# Altium project STEMxS_V1.00.01.PrjPcb
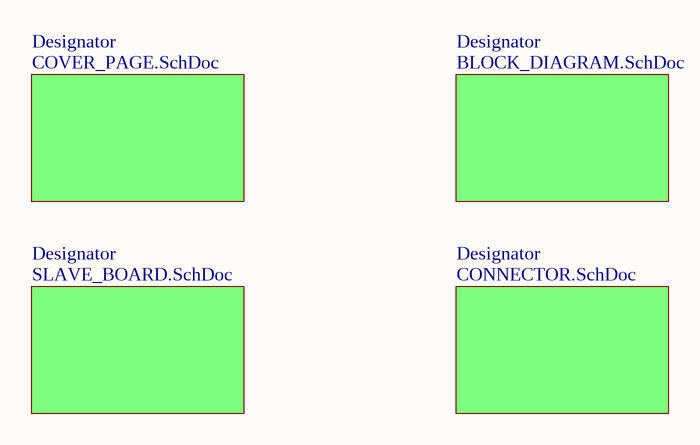
[diagram p0: LINK_PAGE.SchDoc]
5 sheets, 23 parts. Net scope: global (net labels, ports and power ports of the same name join across sheets).
Board file: STEMxS_V1.00.01.PcbDoc
Sheets:
  LINK_PAGE.SchDoc
    Designator = COVER_PAGE.SchDoc
    Designator = BLOCK_DIAGRAM.SchDoc
    Designator = SLAVE_BOARD.SchDoc
    Designator = CONNECTOR.SchDoc

## Sheet LINK_PAGE.SchDoc
size A; SheetNumber: 1; SheetTotal: 5

### Sub-sheets
Designator = COVER_PAGE.SchDoc: no entries
Designator = BLOCK_DIAGRAM.SchDoc: no entries
Designator = SLAVE_BOARD.SchDoc: no entries
Designator = CONNECTOR.SchDoc: no entries

## Sheet COVER_PAGE.SchDoc
size A; SheetNumber: 2; SheetTotal: 4

## Sheet BLOCK_DIAGRAM.SchDoc
size A; SheetNumber: 3; SheetTotal: 4

## Sheet SLAVE_BOARD.SchDoc
size A; SheetNumber: 4; SheetTotal: 5
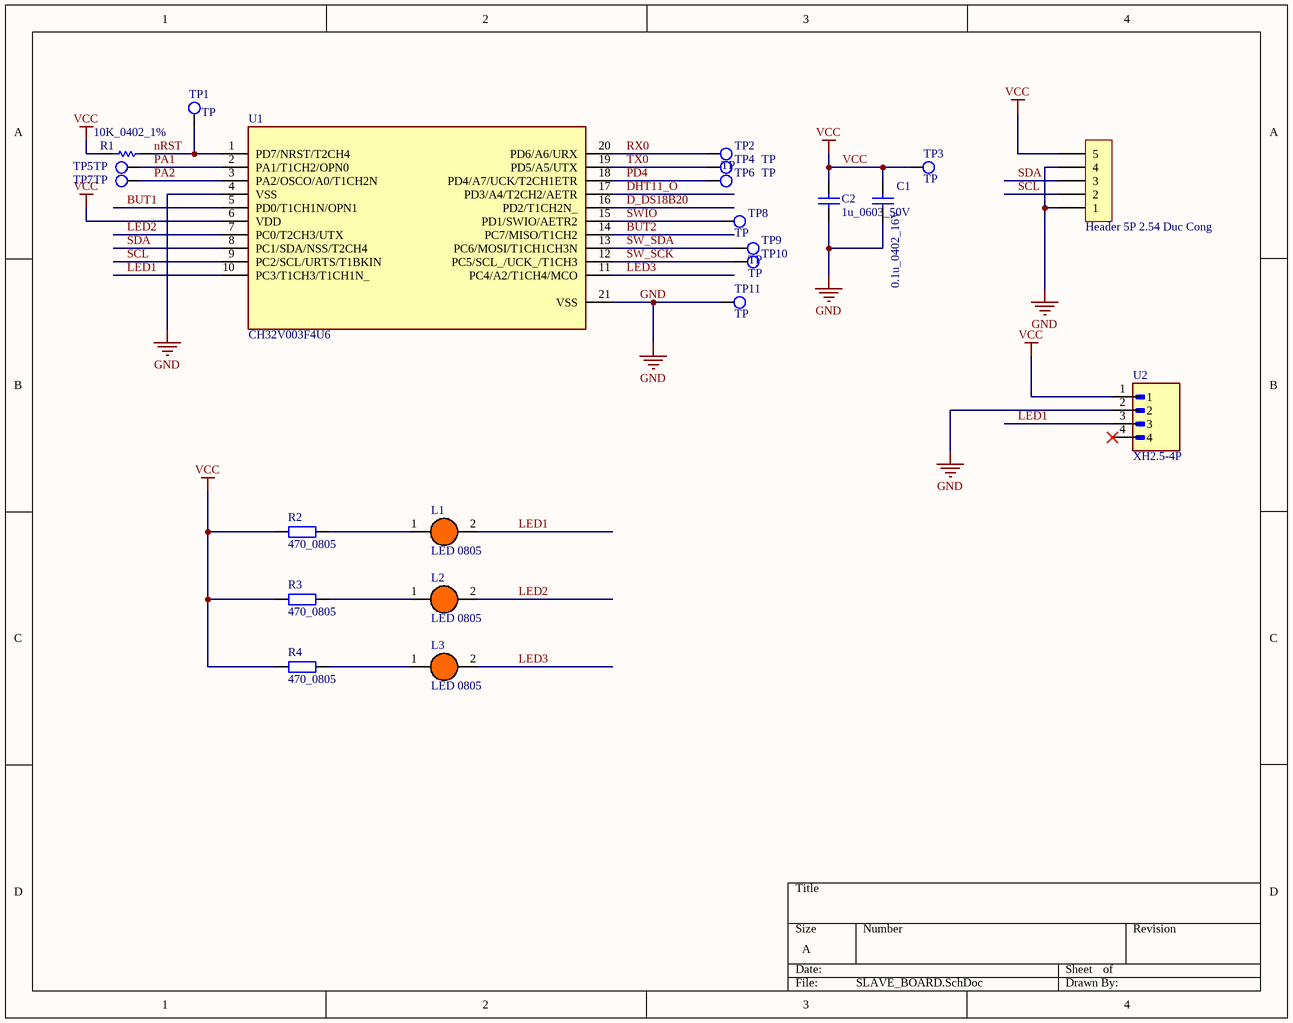
[diagram p1: SLAVE_BOARD.SchDoc]

### Parts
C1  0.1u_0402_16V  [C0402]
C2  1u_0603_50V  [C0603]
H1  Header 5P 2.54 Duc Cong  [Header 5P DC 2.54]
L1  LED 0805  [LED-0805-Orange]
L2  LED 0805  [LED-0805-Orange]
L3  LED 0805  [LED-0805-Orange]
R1  10K_0402_1%  [R0402]
R2  470_0805  [tro smd 0805]
R3  470_0805  [tro smd 0805]
R4  470_0805  [tro smd 0805]
TP1  TP  [TP_1mm]
TP2  TP  [TP_1mm]
TP3  TP  [TP_1mm]
TP4  TP  [TP_1mm]
TP5  TP  [TP_1mm]
TP6  TP  [TP_1mm]
TP7  TP  [TP_1mm]
TP8  TP  [TP_1mm]
TP9  TP  [TP_1mm]
TP10  TP  [TP_1mm]
TP11  TP  [TP_1mm]
U1  CH32V003F4U6  [QFN20_3X3]
U2  XH2.5-4P  [XH2.5-4P]

### Nets
GND: C1.1 C2.1 H1.1 H1.4 TP11.1 U1.4(VSS) U1.21(VSS) U2.2
VCC: C1.2 C2.2 H1.5 R1.1 R2.1 R3.1 R4.1 TP3.1 U1.6(VDD) U2.1
BUT1: U1.5(PD0/T1CH1N/OPN1)
BUT2: U1.14(PC7/MISO/T1CH2)
D_DS18B20: U1.16(PD2/T1CH2N_)
DHT11_O: U1.17(PD3/A4/T2CH2/AETR)
LED1: L1.2(K) U1.10(PC3/T1CH3/T1CH1N_) U2.3
LED2: L2.2(K) U1.7(PC0/T2CH3/UTX)
LED3: L3.2(K) U1.11(PC4/A2/T1CH4/MCO)
nRST: R1.2 TP1.1 U1.1(PD7/NRST/T2CH4)
PA1: TP5.1 U1.2(PA1/T1CH2/OPN0)
PA2: TP7.1 U1.3(PA2/OSCO/A0/T1CH2N)
PD4: TP6.1 U1.18(PD4/A7/UCK/T2CH1ETR)
RX0: TP2.1 U1.20(PD6/A6/URX)
SCL: H1.2 U1.9(PC2/SCL/URTS/T1BKIN)
SDA: H1.3 U1.8(PC1/SDA/NSS/T2CH4)
SW_SCK: TP10.1 U1.12(PC5/SCL_/UCK_/T1CH3)
SW_SDA: TP9.1 U1.13(PC6/MOSI/T1CH1CH3N)
SWIO: TP8.1 U1.15(PD1/SWIO/AETR2)
TX0: TP4.1 U1.19(PD5/A5/UTX)
NetL1_1: L1.1(A) R2.2
NetL2_1: L2.1(A) R3.2
NetL3_1: L3.1(A) R4.2

Not connected (* = marked no-connect by the designer): U2 4*

### Library data of the parts
C1 = C_0402_0.1u_16V
C2 = C_0603_1u_50V
H1 = Header 5P 2.54 Duc Cong: Cắm; Ten_Linh_Kien: Header 5P XH2.54-5P Đực Cong; Don_Vi: Con; Ma_Hang: MH001308; Chung_Loai: Cắm
L1-L3 = LED 0805 Cam: Dán; Don_Vi: Con; Ma_Hang: MH002328; Ten_Linh_Kien: LED 0805 Màu Cam ( Orange); Ghi_Chu: *; Kieu_Chan: *; Chung_Loai: Dán
R1 = R_0402_10K_1%
R2-R4 = Tro 0805 1% 10k: Dán; Don_Vi: Con; So_Chan: 2; Ten_Linh_Kien: Trở 0805 1% 10k; Ma_Hang: MH005473; Chung_Loai: Dán; Kieu_Chan: *
TP1-TP11 = TP: TEST POINT
U2 = XH2.5-4P: https://www.lcsc.com/product-detail/C161861.html

## Sheet CONNECTOR.SchDoc
size A; SheetNumber: 5; SheetTotal: 5